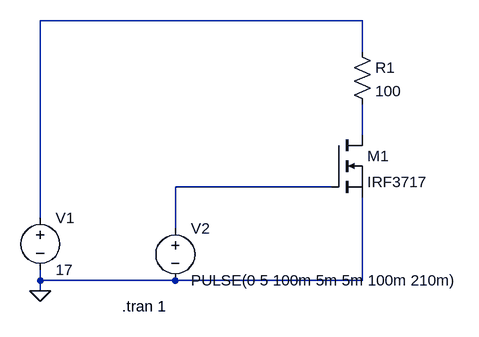
[diagram p0: schematic mosswitch.asc]
mosswitch.asc, the LTspice schematic file:
Version 4
SHEET 1 880 680
WIRE 368 -128 -128 -128
WIRE 368 -80 368 -128
WIRE 368 48 368 0
WIRE 320 128 80 128
WIRE -128 176 -128 -128
WIRE 80 192 80 128
WIRE -128 272 -128 256
WIRE 80 272 -128 272
WIRE 368 272 368 144
WIRE 368 272 80 272
WIRE -128 288 -128 272
FLAG -128 288 0
SYMBOL voltage -128 160 R0
WINDOW 123 0 0 Left 0
WINDOW 39 0 0 Left 0
SYMATTR InstName V1
SYMATTR Value 17
SYMBOL nmos 320 48 R0
SYMATTR InstName M1
SYMATTR Value IRF3717
SYMBOL res 352 -96 R0
SYMATTR InstName R1
SYMATTR Value 100
SYMBOL voltage 80 176 R0
WINDOW 123 0 0 Left 0
WINDOW 39 0 0 Left 0
SYMATTR InstName V2
SYMATTR Value PULSE(0 5 100m 5m 5m 100m 210m)
TEXT -2 312 Left 2 !.tran 1

The netlist it stands for:
* mosswitch.asc
V1 N001 0 17
M1 N002 N003 0 0 IRF3717
R1 N001 N002 100
V2 N003 0 PULSE(0 5 100m 5m 5m 100m 210m)
.model NMOS NMOS
.model PMOS PMOS
.lib standard.mos
.tran 1
.backanno
.end